# Altium schematic sheet 03_SiP_Power.SchDoc
size 812 x 508 mm; SheetNumber: 3; SheetTotal: 16
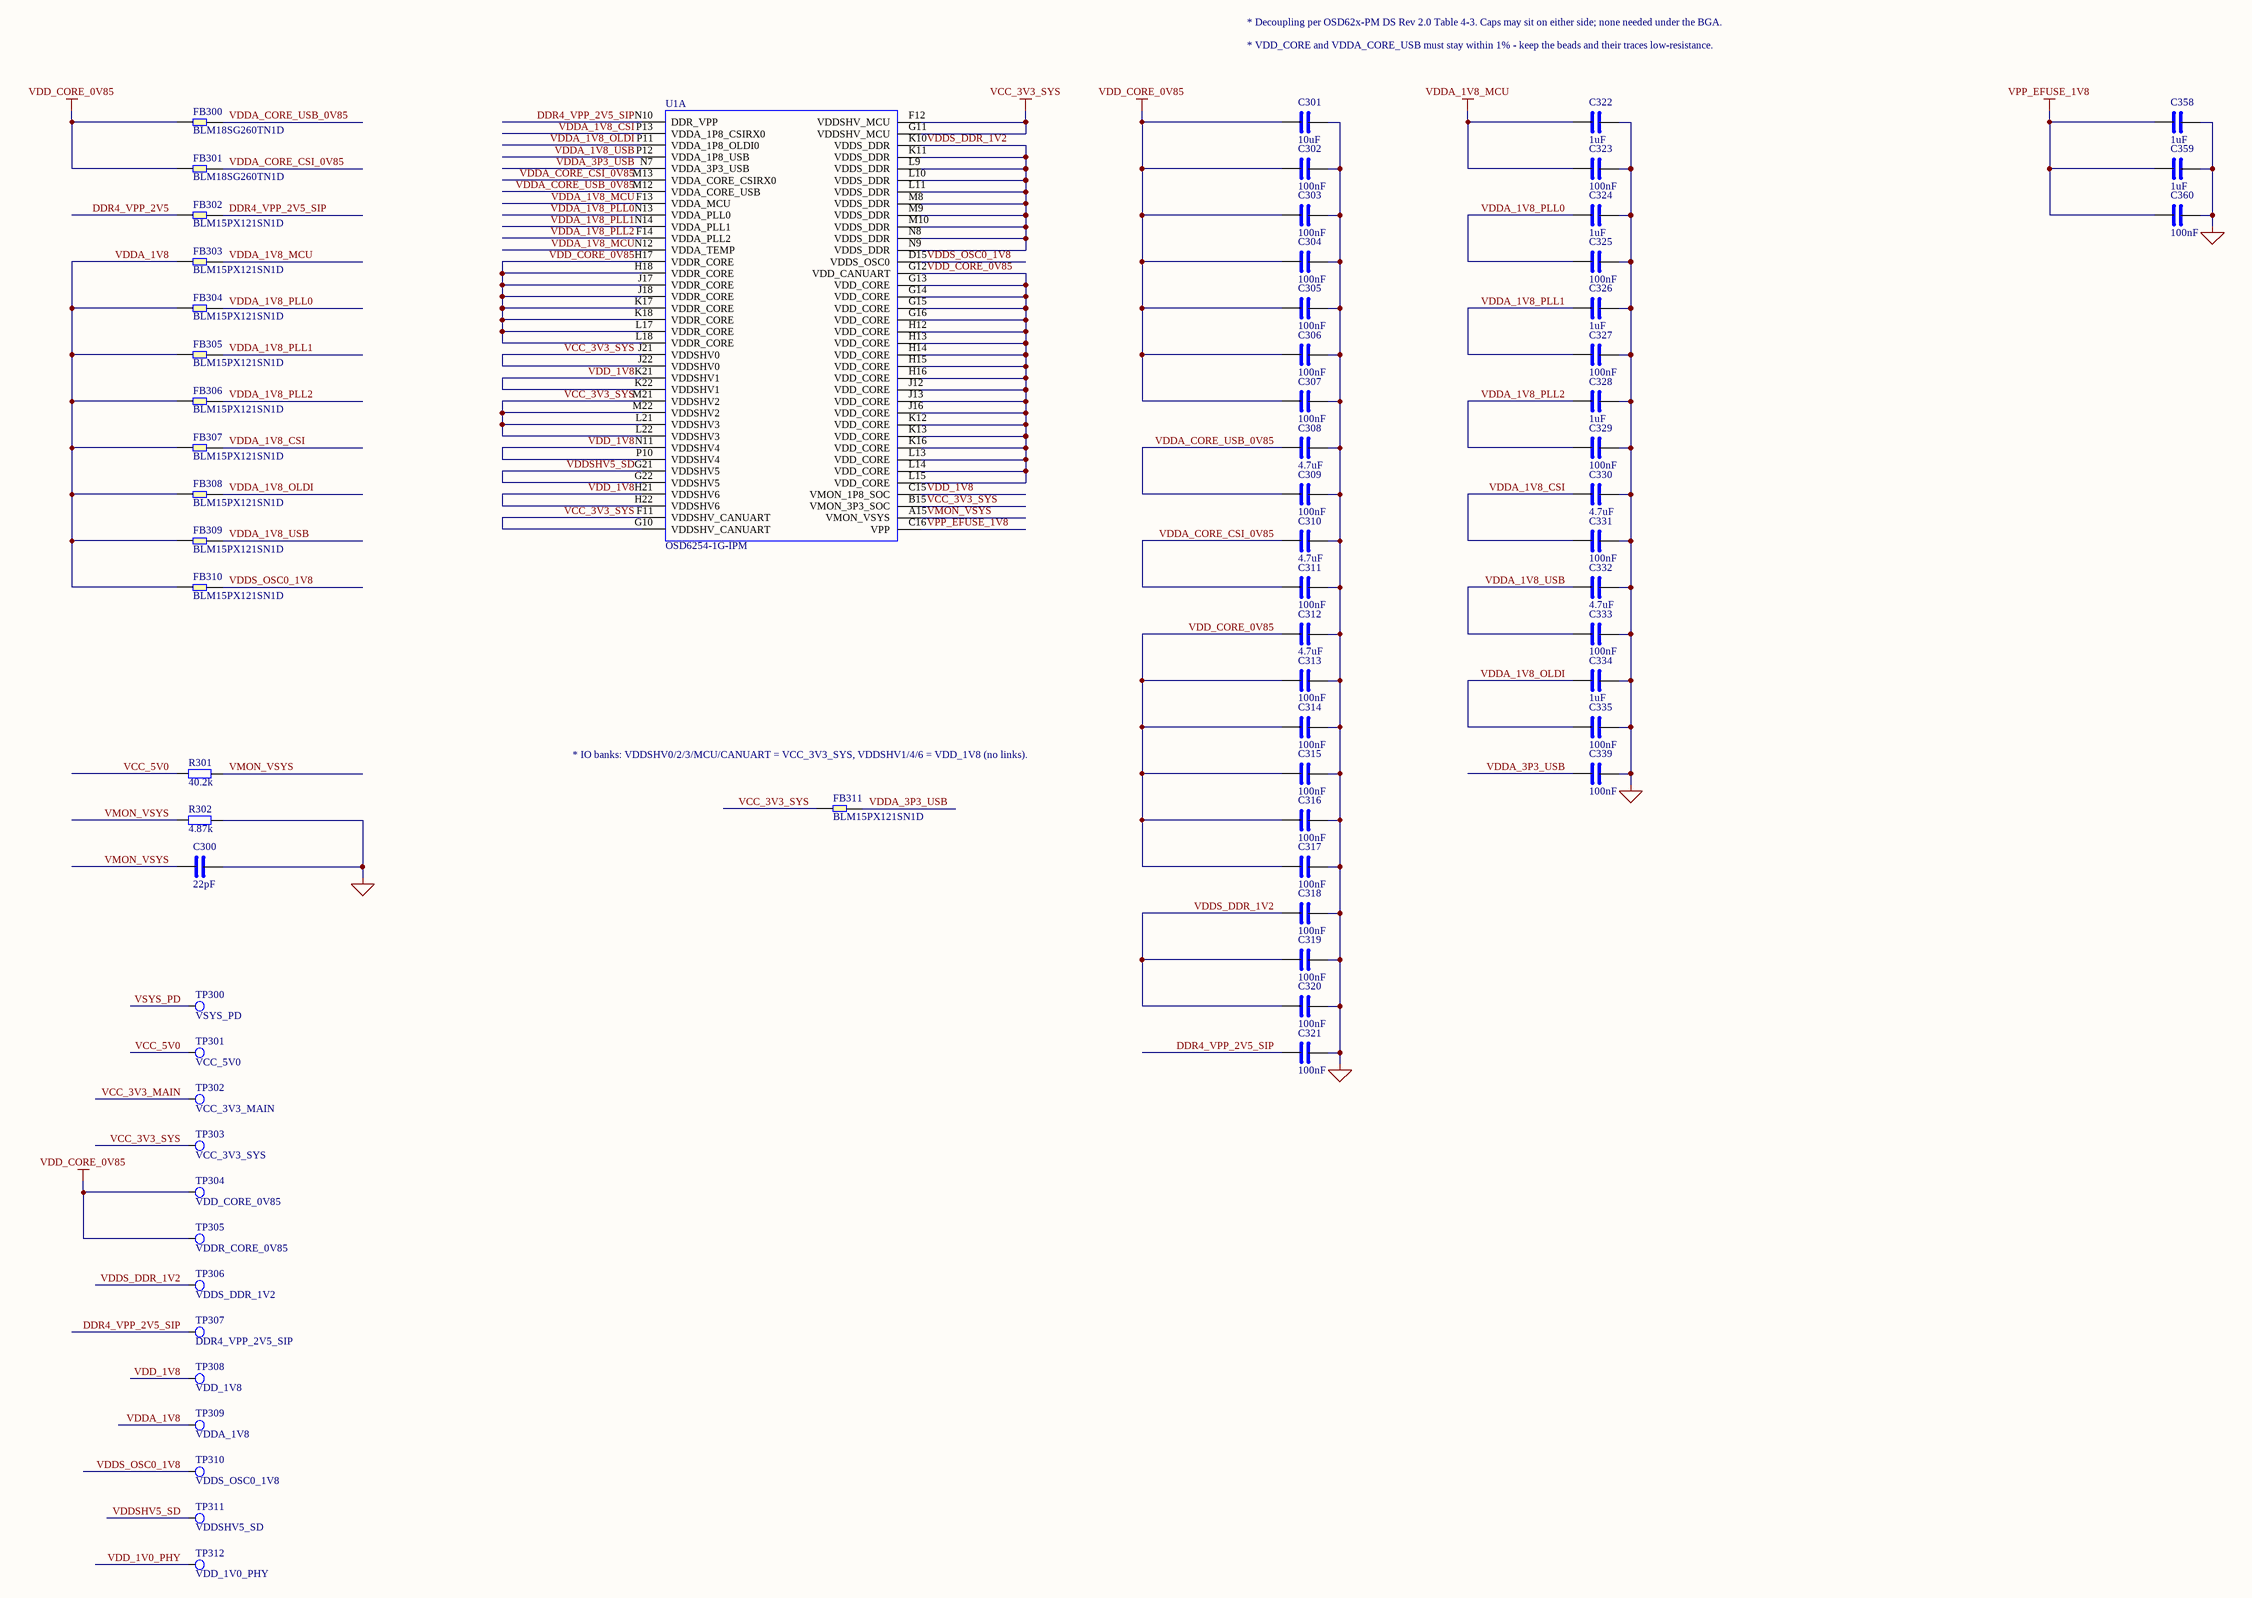
[diagram p0: 03_SiP_Power.SchDoc]

## Parts
C300  22pF  [C0402]
C301  10uF  [C0603]
C302  100nF  [C0402]
C303  100nF  [C0402]
C304  100nF  [C0402]
C305  100nF  [C0402]
C306  100nF  [C0402]
C307  100nF  [C0402]
C308  4.7uF  [C0402]
C309  100nF  [C0402]
C310  4.7uF  [C0402]
C311  100nF  [C0402]
C312  4.7uF  [C0402]
C313  100nF  [C0402]
C314  100nF  [C0402]
C315  100nF  [C0402]
C316  100nF  [C0402]
C317  100nF  [C0402]
C318  100nF  [C0402]
C319  100nF  [C0402]
C320  100nF  [C0402]
C321  100nF  [C0402]
C322  1uF  [C0402]
C323  100nF  [C0402]
C324  1uF  [C0402]
C325  100nF  [C0402]
C326  1uF  [C0402]
C327  100nF  [C0402]
C328  1uF  [C0402]
C329  100nF  [C0402]
C330  4.7uF  [C0402]
C331  100nF  [C0402]
C332  4.7uF  [C0402]
C333  100nF  [C0402]
C334  1uF  [C0402]
C335  100nF  [C0402]
C339  100nF  [C0402]
C358  1uF  [C0402]
C359  1uF  [C0402]
C360  100nF  [C0402]
FB300  BLM18SG260TN1D  [FB0603]
FB301  BLM18SG260TN1D  [FB0603]
FB302  BLM15PX121SN1D  [FB0402]
FB303  BLM15PX121SN1D  [FB0402]
FB304  BLM15PX121SN1D  [FB0402]
FB305  BLM15PX121SN1D  [FB0402]
FB306  BLM15PX121SN1D  [FB0402]
FB307  BLM15PX121SN1D  [FB0402]
FB308  BLM15PX121SN1D  [FB0402]
FB309  BLM15PX121SN1D  [FB0402]
FB310  BLM15PX121SN1D  [FB0402]
FB311  BLM15PX121SN1D  [FB0402]
R301  40.2k  [R0402]
R302  4.87k  [R0402]
TP300  VSYS_PD  [TP_PAD_1.0]
TP301  VCC_5V0  [TP_PAD_1.0]
TP302  VCC_3V3_MAIN  [TP_PAD_1.0]
TP303  VCC_3V3_SYS  [TP_PAD_1.0]
TP304  VDD_CORE_0V85  [TP_PAD_1.0]
TP305  VDDR_CORE_0V85  [TP_PAD_1.0]
TP306  VDDS_DDR_1V2  [TP_PAD_1.0]
TP307  DDR4_VPP_2V5_SIP  [TP_PAD_1.0]
TP308  VDD_1V8  [TP_PAD_1.0]
TP309  VDDA_1V8  [TP_PAD_1.0]
TP310  VDDS_OSC0_1V8  [TP_PAD_1.0]
TP311  VDDSHV5_SD  [TP_PAD_1.0]
TP312  VDD_1V0_PHY  [TP_PAD_1.0]
U1  OSD6254-1G-IPM  [OSD62X-PM_BGA500]  (part A of 9)

## Nets
GND: C300.2 C301.2 C302.2 C303.2 C304.2 C305.2 C306.2 C307.2 C308.2 C309.2 C310.2 C311.2 C312.2 C313.2 C314.2 C315.2 C316.2 C317.2 C318.2 C319.2 C320.2 C321.2 C322.2 C323.2 C324.2 C325.2 C326.2 C327.2 C328.2 C329.2 C330.2 C331.2 C332.2 C333.2 C334.2 C335.2 C339.2 C358.2 C359.2 C360.2 R302.2
VCC_3V3_SYS: FB311.1 TP303.1(TP) U1.B15(VMON_3P3_SOC) U1.F11(VDDSHV_CANUART) U1.F12(VDDSHV_MCU) U1.G10(VDDSHV_CANUART) U1.G11(VDDSHV_MCU) U1.J21(VDDSHV0) U1.J22(VDDSHV0) U1.L21(VDDSHV3) U1.L22(VDDSHV3) U1.M21(VDDSHV2) U1.M22(VDDSHV2)
VDD_CORE_0V85: C301.1 C302.1 C303.1 C304.1 C305.1 C306.1 C307.1 C312.1 C313.1 C314.1 C315.1 C316.1 C317.1 FB300.1 FB301.1 TP304.1(TP) TP305.1(TP) U1.G12(VDD_CANUART) U1.G13(VDD_CORE) U1.G14(VDD_CORE) U1.G15(VDD_CORE) U1.G16(VDD_CORE) U1.H12(VDD_CORE) U1.H13(VDD_CORE) U1.H14(VDD_CORE) U1.H15(VDD_CORE) U1.H16(VDD_CORE) U1.H17(VDDR_CORE) U1.H18(VDDR_CORE) U1.J12(VDD_CORE) U1.J13(VDD_CORE) U1.J16(VDD_CORE) U1.J17(VDDR_CORE) U1.J18(VDDR_CORE) U1.K12(VDD_CORE) U1.K13(VDD_CORE) U1.K16(VDD_CORE) U1.K17(VDDR_CORE) U1.K18(VDDR_CORE) U1.L13(VDD_CORE) U1.L14(VDD_CORE) U1.L15(VDD_CORE) U1.L17(VDDR_CORE) U1.L18(VDDR_CORE)
VDDA_1V8_MCU: C322.1 C323.1 FB303.2 U1.F13(VDDA_MCU) U1.N12(VDDA_TEMP)
VPP_EFUSE_1V8: C358.1 C359.1 C360.1 U1.C16(VPP)
DDR4_VPP_2V5: FB302.1
DDR4_VPP_2V5_SIP: C321.1 FB302.2 TP307.1(TP) U1.N10(DDR_VPP)
VCC_3V3_MAIN: TP302.1(TP)
VCC_5V0: R301.1 TP301.1(TP)
VDD_1V0_PHY: TP312.1(TP)
VDD_1V8: TP308.1(TP) U1.C15(VMON_1P8_SOC) U1.H21(VDDSHV6) U1.H22(VDDSHV6) U1.K21(VDDSHV1) U1.K22(VDDSHV1) U1.N11(VDDSHV4) U1.P10(VDDSHV4)
VDDA_1V8: FB303.1 FB304.1 FB305.1 FB306.1 FB307.1 FB308.1 FB309.1 FB310.1 TP309.1(TP)
VDDA_1V8_CSI: C330.1 C331.1 FB307.2 U1.P13(VDDA_1P8_CSIRX0)
VDDA_1V8_OLDI: C334.1 C335.1 FB308.2 U1.P11(VDDA_1P8_OLDI0)
VDDA_1V8_PLL0: C324.1 C325.1 FB304.2 U1.N13(VDDA_PLL0)
VDDA_1V8_PLL1: C326.1 C327.1 FB305.2 U1.N14(VDDA_PLL1)
VDDA_1V8_PLL2: C328.1 C329.1 FB306.2 U1.F14(VDDA_PLL2)
VDDA_1V8_USB: C332.1 C333.1 FB309.2 U1.P12(VDDA_1P8_USB)
VDDA_3P3_USB: C339.1 FB311.2 U1.N7(VDDA_3P3_USB)
VDDA_CORE_CSI_0V85: C310.1 C311.1 FB301.2 U1.M13(VDDA_CORE_CSIRX0)
VDDA_CORE_USB_0V85: C308.1 C309.1 FB300.2 U1.M12(VDDA_CORE_USB)
VDDS_DDR_1V2: C318.1 C319.1 C320.1 TP306.1(TP) U1.K10(VDDS_DDR) U1.K11(VDDS_DDR) U1.L9(VDDS_DDR) U1.L10(VDDS_DDR) U1.L11(VDDS_DDR) U1.M8(VDDS_DDR) U1.M9(VDDS_DDR) U1.M10(VDDS_DDR) U1.N8(VDDS_DDR) U1.N9(VDDS_DDR)
VDDS_OSC0_1V8: FB310.2 TP310.1(TP) U1.D15(VDDS_OSC0)
VDDSHV5_SD: TP311.1(TP) U1.G21(VDDSHV5) U1.G22(VDDSHV5)
VMON_VSYS: C300.1 R301.2 R302.1 U1.A15(VMON_VSYS)
VSYS_PD: TP300.1(TP)

## Notes on the sheet
- * Decoupling per OSD62x-PM DS Rev 2.0 Table 4-3. Caps may sit on either side; none needed under the BGA.
- * VDD_CORE and VDDA_CORE_USB must stay within 1% - keep the beads and their traces low-resistance.
- * IO banks: VDDSHV0/2/3/MCU/CANUART = VCC_3V3_SYS, VDDSHV1/4/6 = VDD_1V8 (no links).

## Library data of the parts
C300 = CAP: Capacitor, non-polarized; Spec: 22pF 50V C0G 0402 (C1)
C301 = CAP: Capacitor, non-polarized; Spec: 10uF 10V X5R 0603
C302-C307 C309 C311 C314-C321 C323 C325 C327 C329 C331 C333 C335 = CAP: Capacitor, non-polarized; Spec: 100nF 16V X7R 0402
C308 C310 C330 C332 = CAP: Capacitor, non-polarized; Spec: 4.7uF 10V X5R 0402
C312 = CAP: Capacitor, non-polarized; Spec: 4.7uF 10V X5R 0402 (VDD_CANUART ball)
C313 = CAP: Capacitor, non-polarized; Spec: 100nF 16V X7R 0402 (VDD_CANUART ball)
C322 C324 C326 C328 C334 = CAP: Capacitor, non-polarized; Spec: 1uF 10V X5R 0402
C339 = CAP: Capacitor, non-polarized; Spec: 100nF 16V X7R 0402 (VDDA_3P3_USB)
C358 C359 = CAP: Capacitor, non-polarized; DNP: 1; Spec: 1uF 10V X5R 0402 (VPP, DNP)
C360 = CAP: Capacitor, non-polarized; DNP: 1; Spec: 100nF 16V X7R 0402 (VPP, DNP)
FB300 FB301 = FERRITE: Ferrite bead; Spec: BLM18SG260TN1D 26R@100MHz 6A
FB302-FB309 = FERRITE: Ferrite bead; Spec: BLM15PX121SN1D 120R@100MHz 2A
FB310 = FERRITE: Ferrite bead; Spec: BLM15PX121SN1D 120R@100MHz 2A (VDDS_OSC0, 25 MHz osc, PORz gate)
FB311 = FERRITE: Ferrite bead; Spec: BLM15PX121SN1D 120R@100MHz 2A (62_POWER_4 group 5)
R301 = RES: Resistor; MPN: 0402WGF4022TCE; Manufacturer: UNI-ROYAL; Spec: 40.2k 1% 0402 (R2); LCSC: C25893
R302 = RES: Resistor; MPN: 0402WGF4871TCE; Manufacturer: UNI-ROYAL; Spec: 4.87k 1% 0402 (R1); LCSC: C25902
TP300-TP312 = TESTPOINT: Test point
U1 = OSD6254-1G-IPM: Octavo OSD6254 SiP: TI AM6254 + 1 GB DDR4, 9x14 mm 500-ball 0.5 mm BGA; Manufacturer: Octavo Systems; MPN: OSD6254-1G-IPM